# Altium project ArmBand-Control-Board-v2.1.PrjPcb (part 3 of 3)
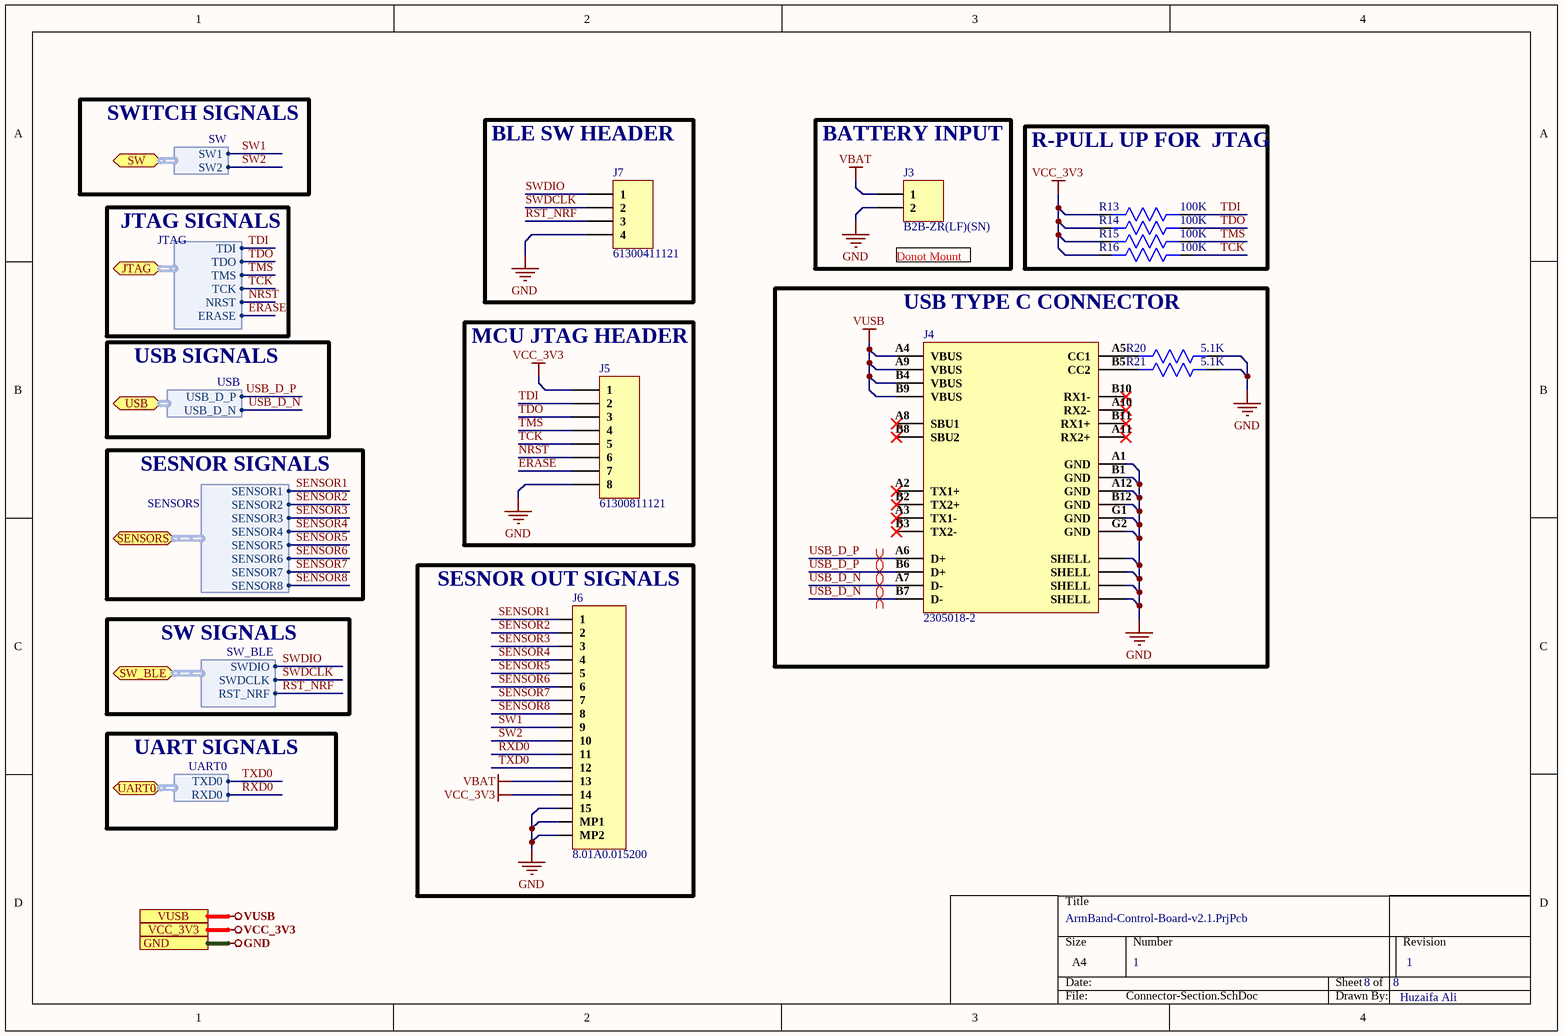
[diagram p8: Connector-Section.SchDoc]

## Nets that join several sheets
GND: Switching-Regulators (16 pins), Battery-Charging-Section (8 pins), Controller-Section (28 pins), IMU-Section (6 pins), BLE-Section (20 pins), Connector-Section (18 pins)
VBAT: Switching-Regulators (8 pins), Battery-Charging-Section (C2.1 R1.1 U1.9), Connector-Section (J3.1 J6.13)
VCC_3V3: Switching-Regulators (6 pins), Controller-Section (16 pins), IMU-Section (7 pins), BLE-Section (6 pins), Connector-Section (6 pins)
VUSB: Battery-Charging-Section (C1.1 R2.2 R3.2 U1.2), Connector-Section (J4.A4 J4.A9 J4.B4 J4.B9)
BATT_EN: Battery-Charging-Section (R17.2 U1.6), Controller-Section (U5.48)
ERASE: Controller-Section (U5.55), Connector-Section (J5.7)
INT1: Controller-Section (U5.30), IMU-Section (U7.4)
INT2: Controller-Section (U5.29), IMU-Section (U7.9)
NRST: Controller-Section (C24.1 R8.1 SW1.1 U5.39), Connector-Section (J5.6)
RST_NRF: BLE-Section (U6.16), Connector-Section (J7.3)
RXD0: Controller-Section (U5.35), Connector-Section (J6.11)
SCL: Controller-Section (U5.36), IMU-Section (R10.1 U7.13)
SDA: Controller-Section (U5.43), IMU-Section (R11.1 U7.14)
SENSOR1: Controller-Section (U5.9), Connector-Section (J6.1)
SENSOR2: Controller-Section (U5.10), Connector-Section (J6.2)
SENSOR3: Controller-Section (U5.13), Connector-Section (J6.3)
SENSOR4: Controller-Section (U5.16), Connector-Section (J6.4)
SENSOR5: Controller-Section (U5.3), Connector-Section (J6.5)
SENSOR6: Controller-Section (U5.4), Connector-Section (J6.6)
SENSOR7: Controller-Section (U5.5), Connector-Section (J6.7)
SENSOR8: Controller-Section (U5.6), Connector-Section (J6.8)
SW1: Controller-Section (U5.59), Connector-Section (J6.9)
SW2: Controller-Section (U5.63), Connector-Section (J6.10)
SWDCLK: BLE-Section (U6.17), Connector-Section (J7.2)
SWDIO: BLE-Section (U6.18), Connector-Section (J7.1)
TCK: Controller-Section (U5.53), Connector-Section (J5.5 R16.1)
TDI: Controller-Section (U5.33), Connector-Section (J5.2 R13.1)
TDO: Controller-Section (U5.49), Connector-Section (J5.3 R14.1)
TMS: Controller-Section (U5.51), Connector-Section (J5.4 R15.1)
TXD0: Controller-Section (U5.34), Connector-Section (J6.12)
UART_CTS: Controller-Section (U5.25), BLE-Section (U6.11)
UART_RTS: Controller-Section (U5.23), BLE-Section (U6.8)
UART_RXD: Controller-Section (U5.11), BLE-Section (U6.12)
UART_TXD: Controller-Section (U5.14), BLE-Section (U6.10)
USB_D_N: Controller-Section (U5.56), Connector-Section (J4.A7 J4.B7)
USB_D_P: Controller-Section (U5.57), Connector-Section (J4.A6 J4.B6)